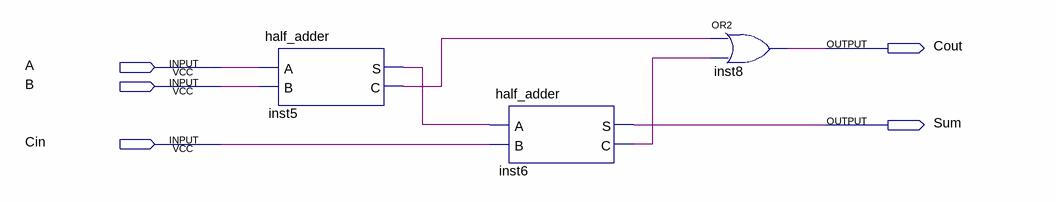
[diagram p0: schematic sheet]
// Quartus schematic design_LAB_4.bdf as structural Verilog: 3 symbols, 5 pins
module design_LAB_4 (
  input  A,
  input  B,
  input  Cin,
  output Cout,
  output Sum
);

  wire inst5_c, inst5_s, inst6_c;

  half_adder inst5 (.A(A), .B(B), .S(inst5_s), .C(inst5_c));
  half_adder inst6 (.A(inst5_s), .B(Cin), .S(Sum), .C(inst6_c));
  or inst8 (Cout, inst5_c, inst6_c);
endmodule
